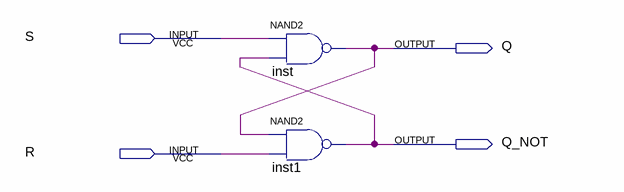
[diagram p0: schematic sheet]
// Quartus schematic WILLIAMS_DWANN_SR_LATCH.bdf as structural Verilog: 2 symbols, 4 pins
module WILLIAMS_DWANN_SR_LATCH (
  input  S,
  input  R,
  output Q,
  output Q_NOT
);

  nand inst (Q, S, Q_NOT);
  nand inst1 (Q_NOT, Q, R);
endmodule
